# EasyEDA Pro project 2026Rc_R2_routed.epro

# Schematic Schematic1
Board Name: Board1; Create Date: 2025-09-02; Page Name: P1; Project Name: 2025物流车拓展板树莓派版专用; Schematic Name: Schematic1; Update Date: 2025-09-02; Company: 嘉立创EDA; Page Size: A4; Version: V1.0
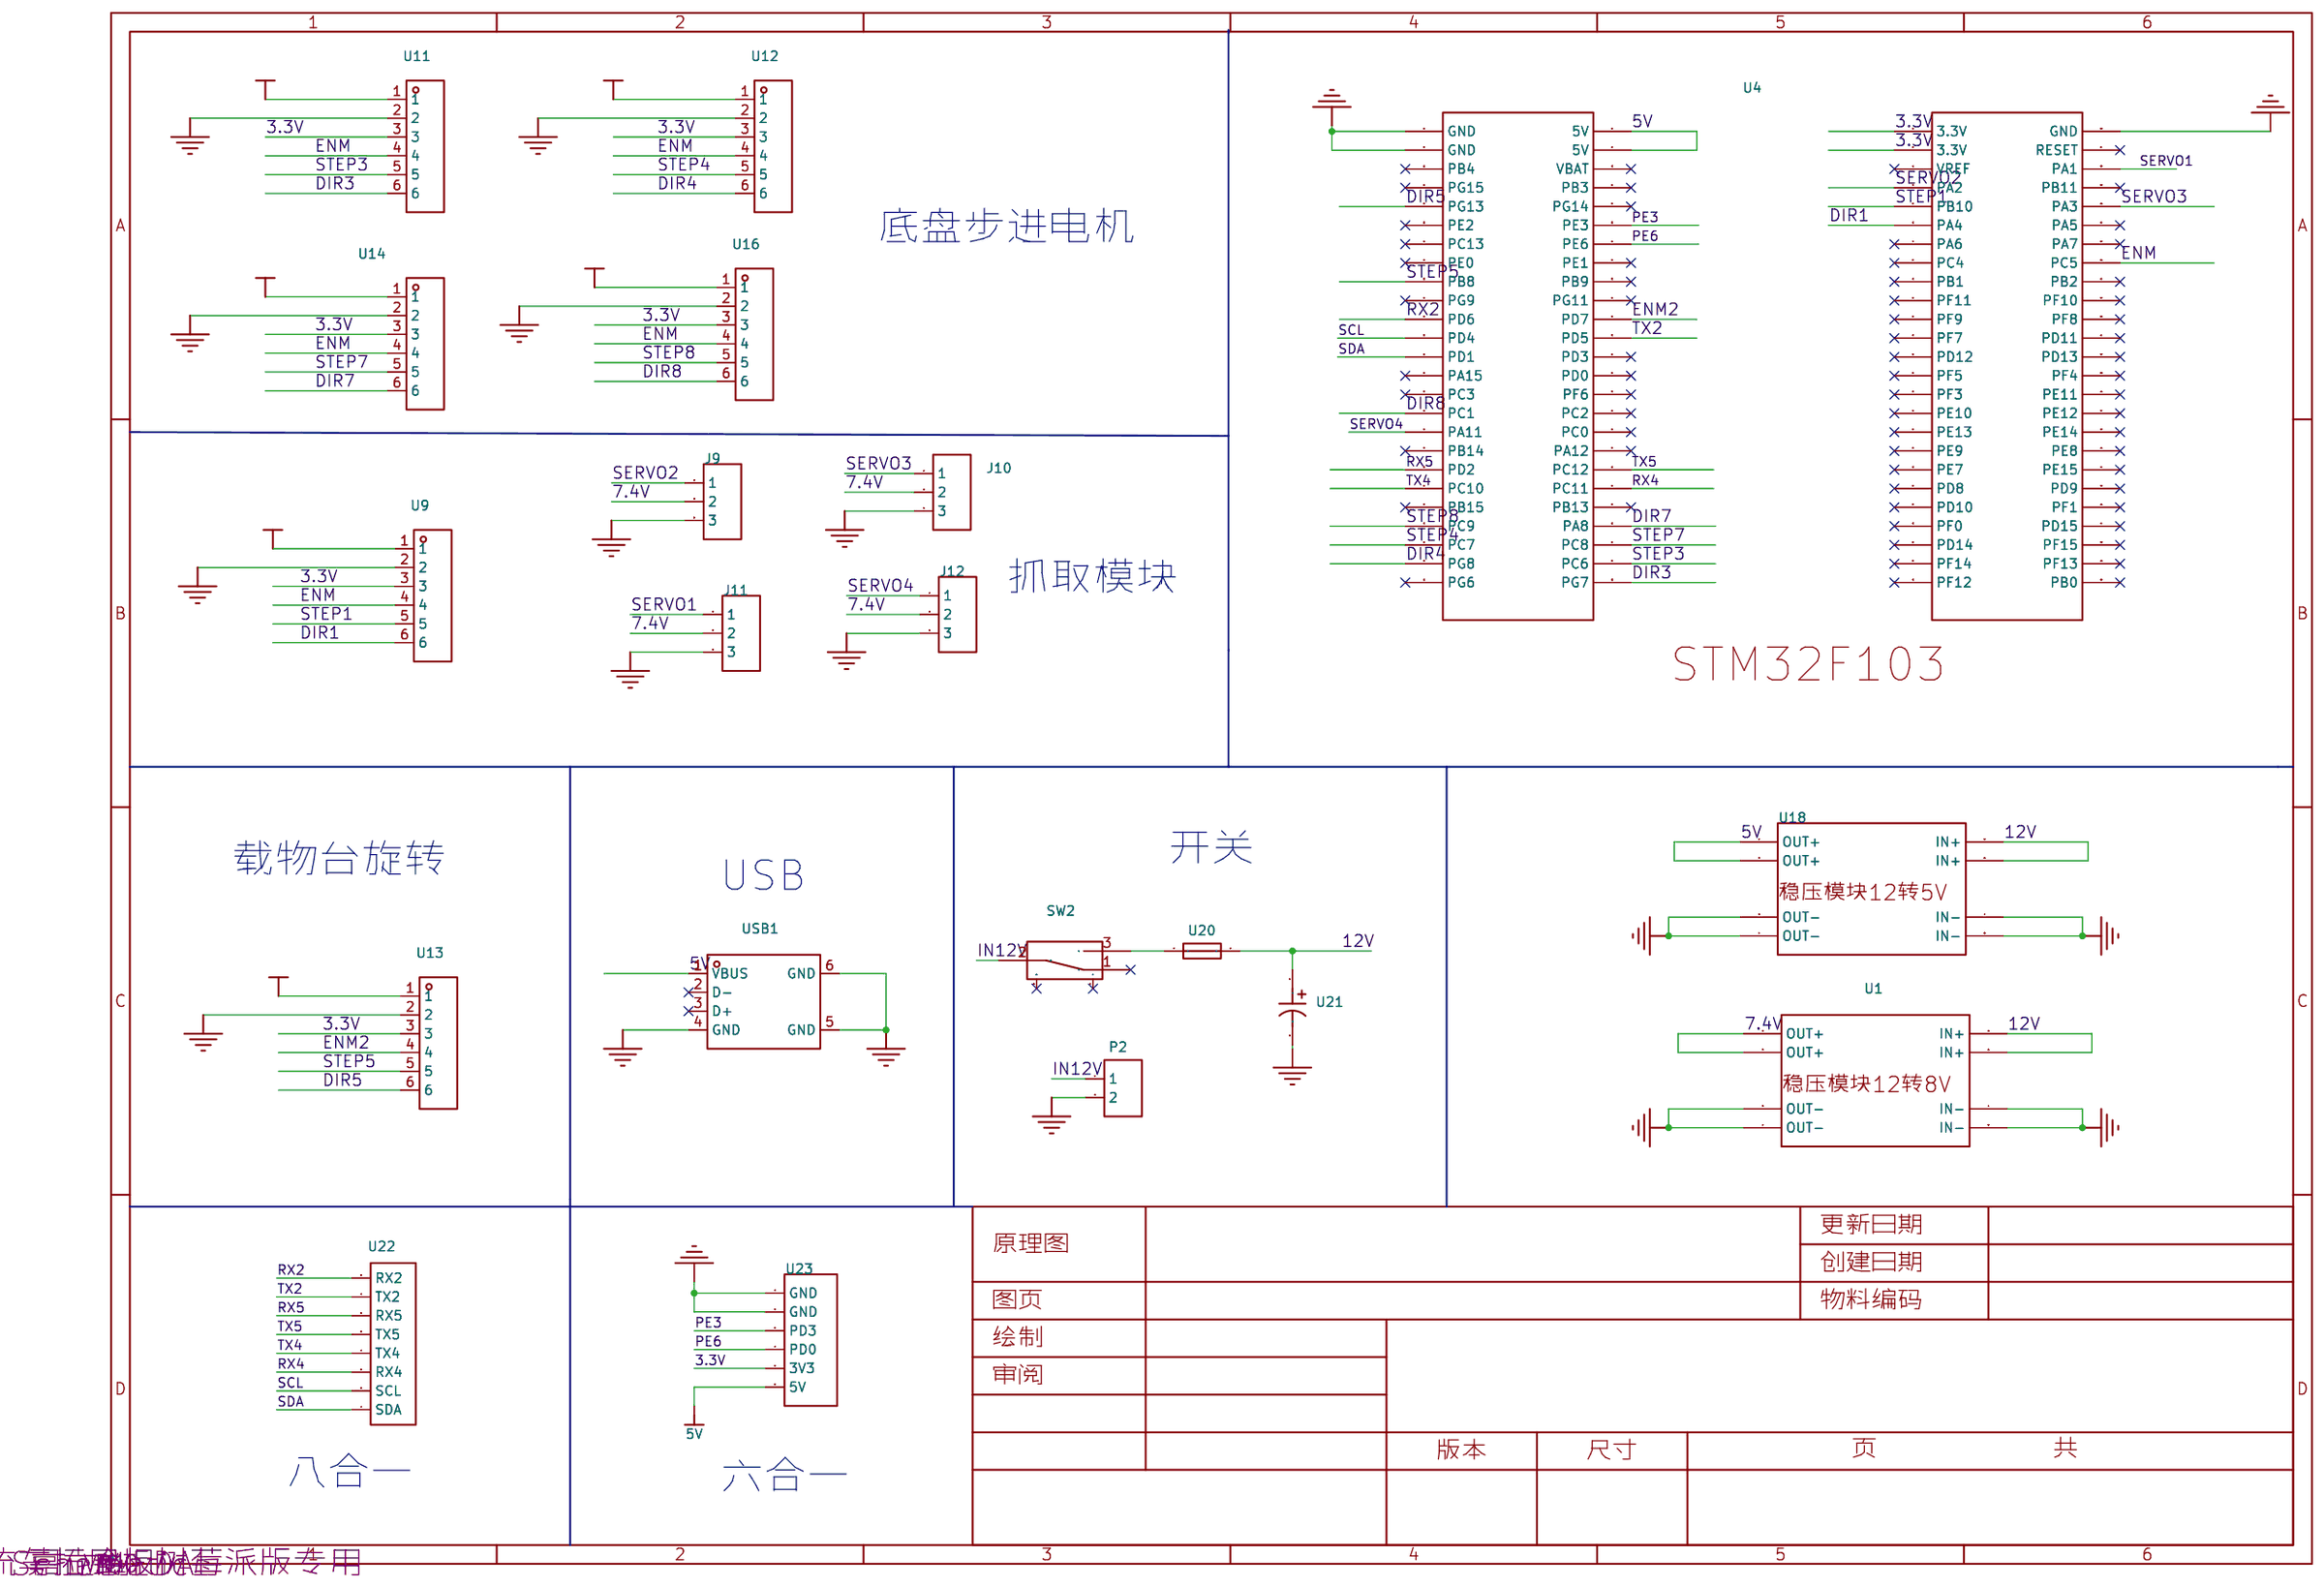
[diagram p0: schematic sheet]

## Parts
J9  舵机2  [HDR-M-2.54_1X3]
J10  舵机1  [HDR-M-2.54_1X3]
J11  舵机2  [HDR-M-2.54_1X3]
J12  舵机2  [HDR-M-2.54_1X3]
P2  输入  [CONN-TH_2P-P5.00]
SW2  SS-12F44-G5  [SW-TH_SS-12F44-G5]
U1  稳压模块12-8  [稳压模块12到8V]
U4  STM32_F103  [STM32F103]
U9  6PIN-2.54MM  [CONN-TH_XH2.54-6P]
U11  6PIN-2.54MM  [CONN-TH_XH2.54-6P]
U12  6PIN-2.54MM  [CONN-TH_XH2.54-6P]
U13  6PIN-2.54MM  [CONN-TH_XH2.54-6P]
U14  6PIN-2.54MM  [CONN-TH_XH2.54-6P]
U16  6PIN-2.54MM  [CONN-TH_XH2.54-6P]
U18  -  [稳压模块12到5V]
U20  -  [保险丝]
U21  -  [滤波电容220nf]
U22  -  [CN1]
U23  -  [CONN-TH_XH2.54-6P]
USB1  USB-231-ARY  [USB-A-TH_USB-231-ARY]

## Library data of the parts
J9 J11 J12 = 舵机2: Supplier Part: C180248; Supplier: LCSC
J10 = 舵机1: Supplier Part: C180248; Supplier: LCSC
P2 = 输入: Supplier: LCSC
SW2 = SS-12F44-G5: Supplier: LCSC; Supplier Part: C136718; Manufacturer: Rectangular Connectors - Contacts
U1 = 稳压模块12-8
U4 = STM32_F103
U9 U11-U14 U16 = 6PIN-2.54MM: Supplier: LCSC; Supplier Part: C9900021155; Manufacturer: null; JLCPCB Part Class: Extended Part
U18 = 稳压模块12-5
U20 = 保险丝
U21 = 滤波电容220nf
U22 = 八合一
U23 = 六合一
USB1 = USB-231-ARY: Supplier: LCSC; Supplier Part: C720525; Manufacturer: XUNPU(讯普); JLCPCB Part Class: Extended Part

## Nets
3.3V: U4.1(3.3V) U4.2(3.3V) U9.3 U11.3 U12.3 U13.3 U14.3 U16.3 U23.5(3V3)
5V: U4.76(5V) U4.77(5V) U18.1(OUT+) U18.2(OUT+) U23.6(5V) USB1.1(VBUS)
7.4V: J9.2 J10.2 J11.2 J12.2 U1.1(OUT+) U1.2(OUT+)
12V: U1.5(IN+) U1.6(IN+) U9.1 U11.1 U12.1 U13.1 U14.1 U16.1 U18.5(IN+) U18.6(IN+) U20.2 U21.1
GND: J9.3 J10.3 J11.3 J12.3 P2.2 U1.3(OUT-) U1.4(OUT-) U1.7(IN-) U1.8(IN-) U4.26(GND) U4.51(GND) U4.52(GND) U9.2 U11.2 U12.2 U13.2 U14.2 U16.2 U18.3(OUT-) U18.4(OUT-) U18.7(IN-) U18.8(IN-) U21.2 U23.1(GND) U23.2(GND) USB1.4(GND) USB1.5(GND) USB1.6(GND)
DIR1: U4.6(PA4) U9.6
DIR3: U4.100(PG7) U11.6
DIR4: U4.74(PG8) U12.6
DIR5: U4.55(PG13) U13.6
DIR7: U4.97(PA8) U14.6
DIR8: U4.66(PC1) U16.6
ENM: U4.33(PC5) U9.4 U11.4 U12.4 U14.4 U16.4
ENM2: U4.86(PD7) U13.4
IN12V: P2.1 SW2.2
PE3: U4.81(PE3) U23.3(PD3)
PE6: U4.82(PE6) U23.4(PD0)
RX2: U4.61(PD6) U22.8(RX2)
RX4: U4.95(PC11) U22.5(RX4)
RX5: U4.69(PD2) U22.2(RX5)
SCL: U4.62(PD4) U22.6(SCL)
SDA: U4.63(PD1) U22.7(SDA)
SERVO1: J11.1 U4.28(PA1)
SERVO2: J9.1 U4.4(PA2)
SERVO3: J10.1 U4.30(PA3)
SERVO4: J12.1 U4.67(PA11)
STEP1: U4.5(PB10) U9.5
STEP3: U4.99(PC6) U11.5
STEP4: U4.73(PC7) U12.5
STEP5: U4.59(PB8) U13.5
STEP7: U4.98(PC8) U14.5
STEP8: U4.72(PC9) U16.5
TX2: U4.87(PD5) U22.1(TX2)
TX4: U4.70(PC10) U22.4(TX4)
TX5: U4.94(PC12) U22.3(TX5)
$1N1669: SW2.3 U20.1

Not connected (* = marked no-connect by the designer): SW2 1* 4* 5*; U4 3(VREF)* 7(PA6)* 8(PC4)* 9(PB1)* 10(PF11)* 11(PF9)* 12(PF7)* 13(PD12)* 14(PF5)* 15(PF3)* 16(PE10)* 17(PE13)* 18(PE9)* 19(PE7)* 20(PD8)* 21(PD10)* 22(PF0)* 23(PD14)* 24(PF14)* 25(PF12)* 27(RESET)* 29(PB11)* 31(PA5)* 32(PA7)* 34(PB2)* 35(PF10)* 36(PF8)* 37(PD11)* 38(PD13)* 39(PF4)* 40(PE11)* 41(PE12)* 42(PE14)* 43(PE8)* 44(PE15)* 45(PD9)* 46(PF1)* 47(PD15)* 48(PF15)* 49(PF13)* 50(PB0)* 53(PB4)* 54(PG15)* 56(PE2)* 57(PC13)* 58(PE0)* 60(PG9)* 64(PA15)* 65(PC3)* 68(PB14)* 71(PB15)* 75(PG6)* 78(VBAT)* 79(PB3)* 80(PG14)* 83(PE1)* 84(PB9)* 85(PG11)* 88(PD3)* 89(PD0)* 90(PF6)* 91(PC2)* 92(PC0)* 93(PA12)* 96(PB13)*; USB1 2(D-)* 3(D+)*

## Notes on the sheet
- 底盘步进电机
- 抓取模块
- 载物台旋转
- 开关
- USB
- 八合一
- 六合一

# Board PCB1
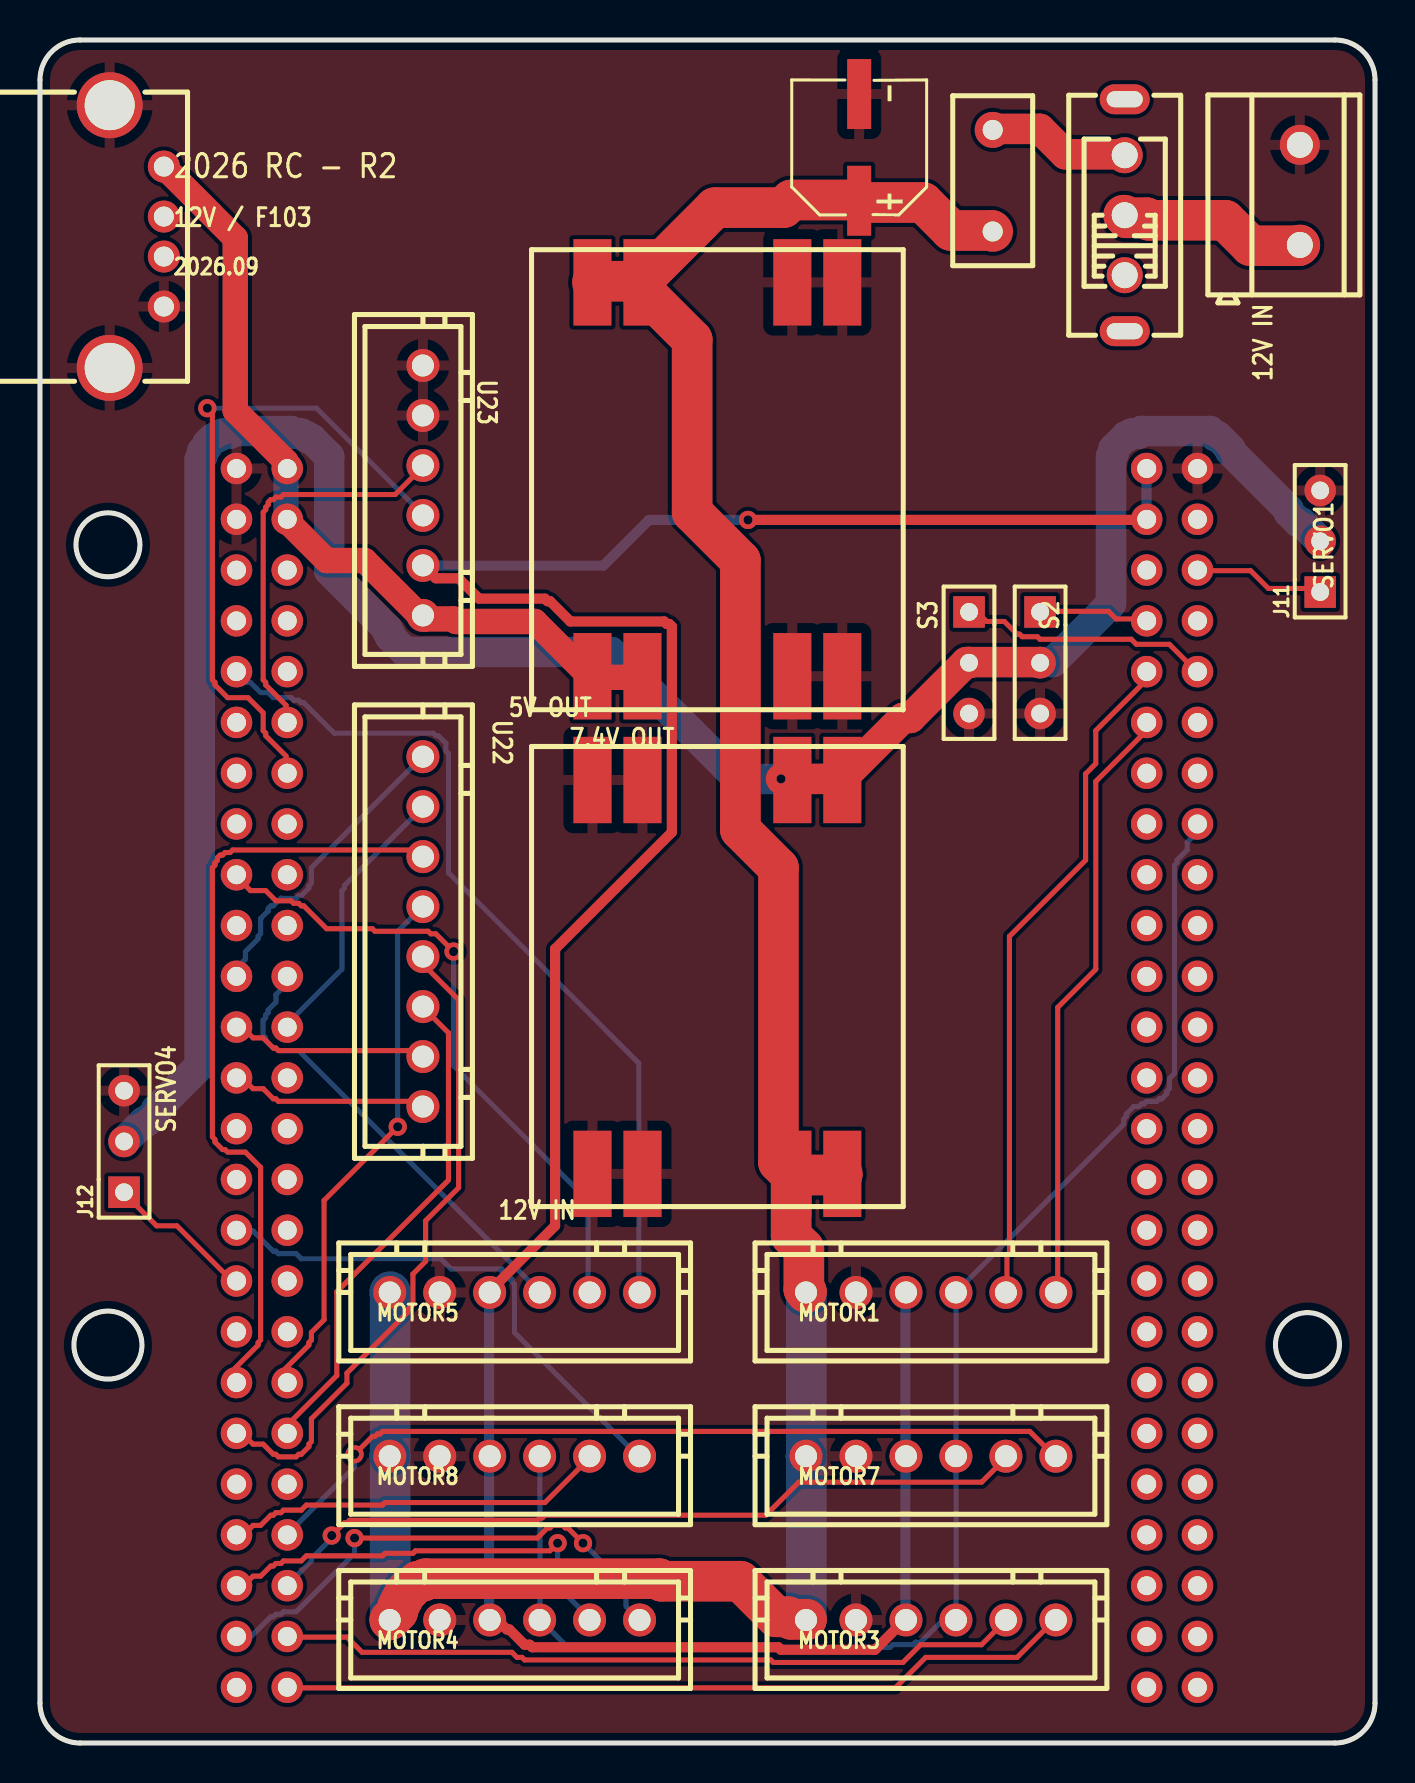
[diagram p1: board, top side]
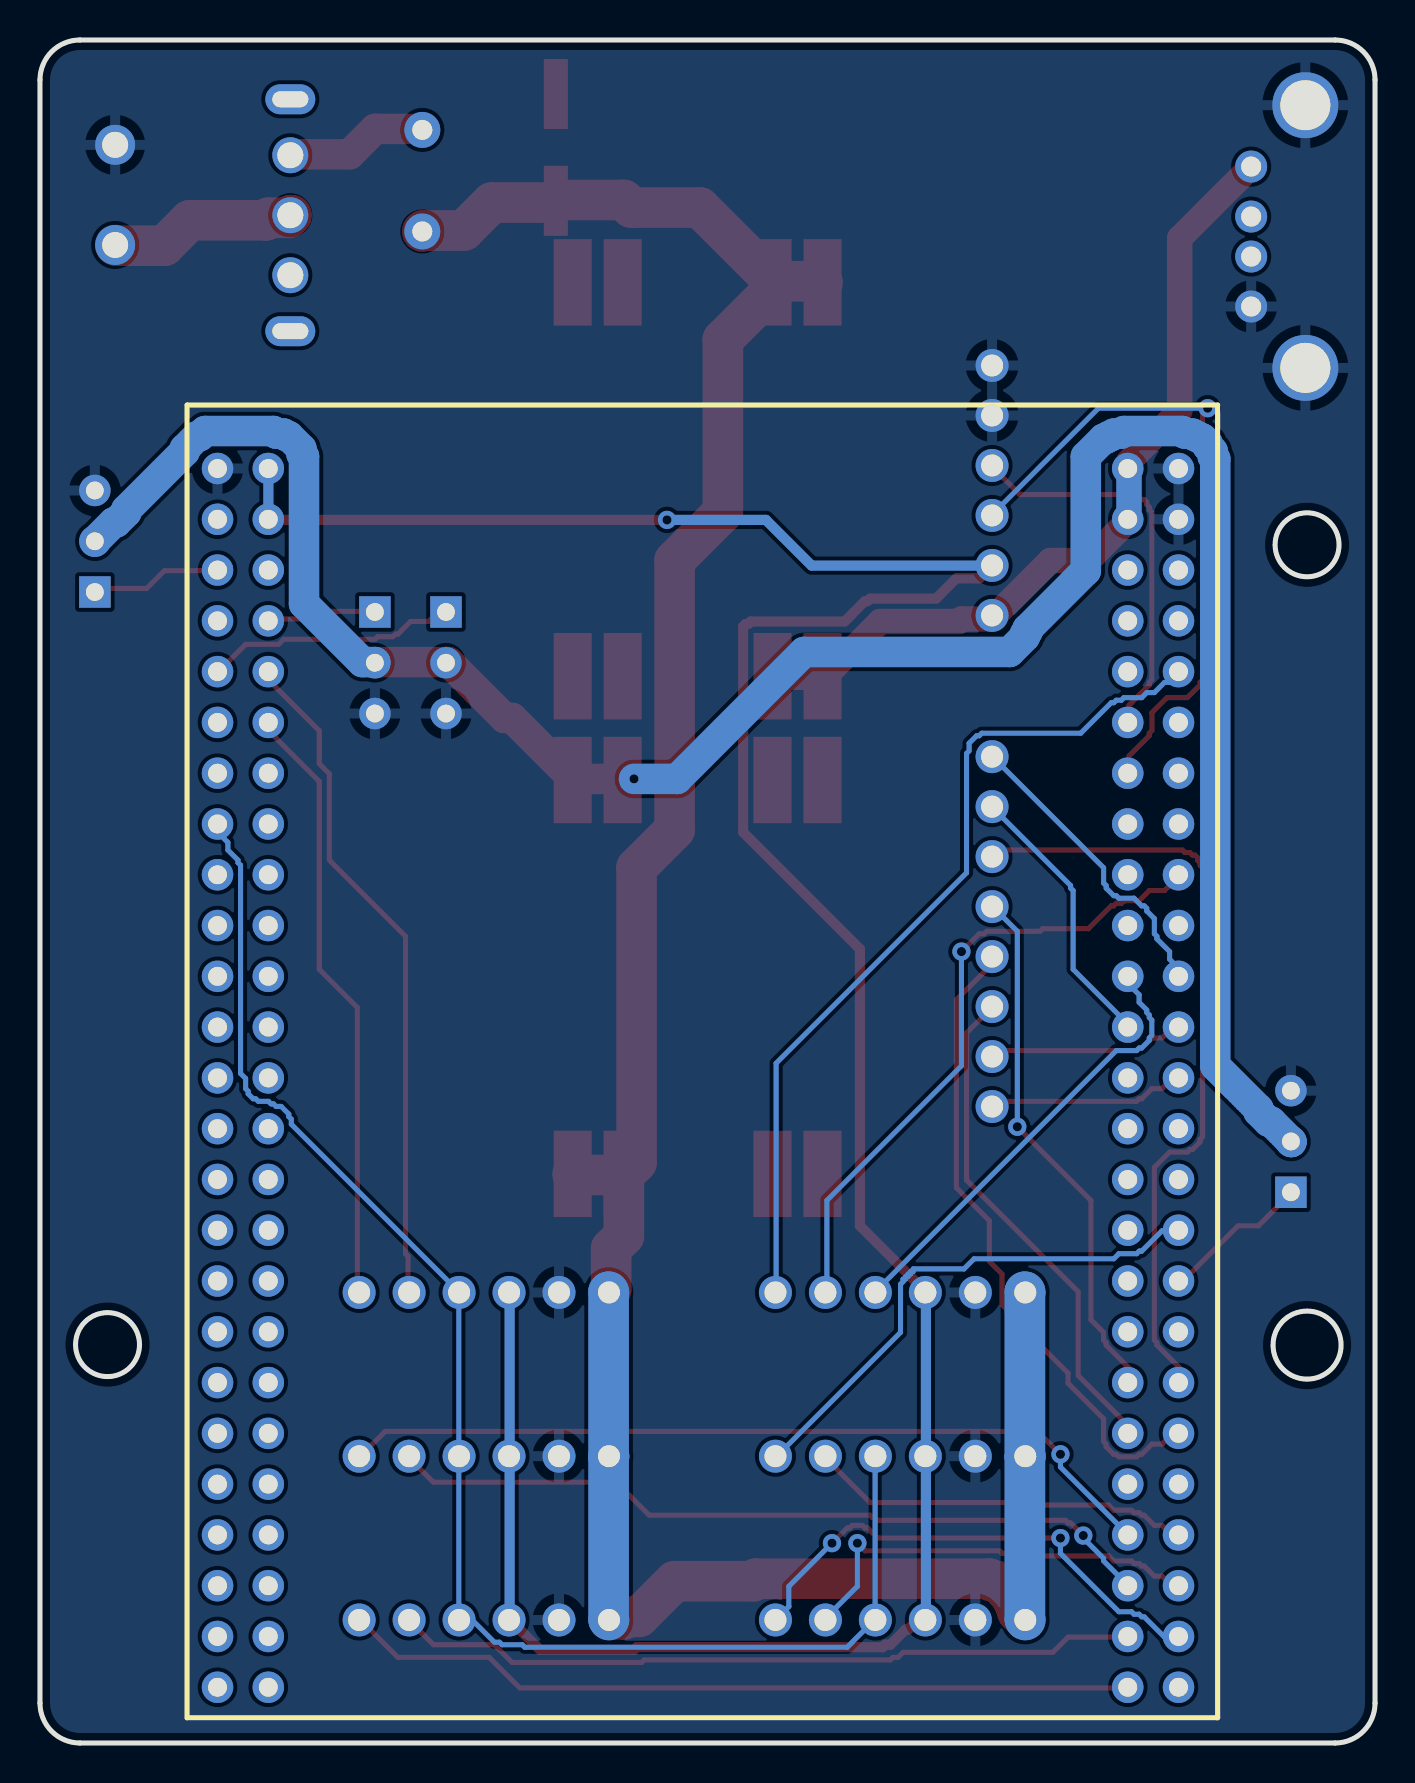
[diagram p2: board, bottom side, seen from below]

Outline 66.8 x 85.18 mm; copper layers: Top Layer, Bottom Layer. Coordinates in mm from the lower left corner of the outline.
Outline path: circle c3.4,59.93 r1.6 ; circle c3.4,19.9 r1.7 ; circle c63.42,19.93 r1.6 ; 0,83.18 0,2 arc(0.59,0.59) 2,0 64.8,0 arc(66.21,0.59) 66.8,2 66.8,83.18 arc(66.21,84.6) 64.8,85.18 2,85.18 arc(0.59,84.6) 0,83.18
Stack: Top Layer 0.035mm / Dielectric1 1.51mm FR4 er 4.5 / Bottom Layer 0.035mm

## Design rules (mm)
spacing copperThickness1oz (default): track to track 0.102, other pairs 0.152 to 0.3
spacing copperThickness2oz: track to track 0.203, other pairs 0.152 to 0.3
spacing Plane_innerPlane: track to track 0.102, other pairs 0.152 to 0.3
spacing Copper_copperRegion: track to track 0.102, other pairs 0.152 to 0.3
track width copperThickness1oz (default): min 0.127, default 0.254, max 2.54
track width copperThickness2oz: min 0.203, default 0.254, max 2.54
track width 5V: min 0.127, default 0.762, max 2.54
track width 12V: min 0.127, default 1.016, max 2.54
track width 3.3V: min 0.127, default 0.508, max 2.54
track width GND: min 0.127, default 0.762, max 2.54
differential pair differentialPair (default): width min 0.127, default 0.254, max 2.54; gap min 0.152, default 0.152
pour e10020 uses Copper_copperRegion
pour e10021 uses Copper_copperRegion

## Placement (name value [footprint] x y rotation side)
J9  舵机2  [HDR-M-2.54_1X3]  50.04 54.03 270 top
J10  舵机1  [HDR-M-2.54_1X3]  46.48 54.03 270 top
J11  舵机2  [HDR-M-2.54_1X3]  64.05 60.11 90 top
J12  舵机2  [HDR-M-2.54_1X3]  4.21 30.09 90 top
P2  输入  [CONN-TH_2P-P5.00]  63.03 77.43 90 top
SW2  SS-12F44-G5  [SW-TH_SS-12F44-G5]  54.27 76.42 90 top
U1  稳压模块12-8  [稳压模块12到8V]  33.89 38.32 90 top
U4  STM32_F103  [STM32F103]  33.66 34.09 180 bottom
U9  6PIN-2.54MM  [CONN-TH_XH2.54-6P]  44.58 22.54 0 top
U11  6PIN-2.54MM  [CONN-TH_XH2.54-6P]  44.58 6.15 0 top
U12  6PIN-2.54MM  [CONN-TH_XH2.54-6P]  23.75 6.15 0 top
U13  6PIN-2.54MM  [CONN-TH_XH2.54-6P]  23.75 22.54 0 top
U14  6PIN-2.54MM  [CONN-TH_XH2.54-6P]  44.58 14.35 0 top
U16  6PIN-2.54MM  [CONN-TH_XH2.54-6P]  23.75 14.35 0 top
U18  -  [稳压模块12到5V]  33.89 63.21 270 top
U20  -  [保险丝]  47.67 78.14 270 top
U21  -  [滤波电容220nf]  40.99 79.81 90 top
U22  -  [CN1]  19.07 40.59 270 top
U23  -  [CONN-TH_XH2.54-6P#2]  18.69 62.65 270 top
USB1  USB-231-ARY  [USB-A-TH_USB-231-ARY]  4.84 75.35 270 top

## Footprints (pads in the part's own frame, mm; a bottom-side part is the same pattern mirrored in y, then rotated)
CN1
  round 1.65 hole 1.1: 1(-6.25,0.094) 2(-3.75,0.094) 3(-1.25,0.094) 4(1.25,0.094) 5(3.75,0.094) 6(6.25,0.094) 7(8.75,0.094) 8(-8.75,0.094)
CONN-TH_2P-P5.00
  round 2 hole 1.3: 1(-2.505,0) 2(2.505,0)
CONN-TH_XH2.54-6P
  round 1.65 hole 1.1: 1(-6.25,0) 2(-3.75,0) 3(-1.25,0) 4(1.25,0) 5(3.75,0) 6(6.25,0)
CONN-TH_XH2.54-6P#2
  round 1.65 hole 1.1: 1(-6.25,0.475) 2(-3.75,0.475) 3(-1.25,0.475) 4(1.25,0.475) 5(3.75,0.475) 6(6.25,0.475)
HDR-M-2.54_1X3
  rect 1.575x1.575 hole 0.889: 1(-2.54,0)
  round 1.575 hole 0.889: 2(0,0) 3(2.54,0)
STM32F103
  round 1.575 hole 0.945: 1(-21.717,29.654) 2(-21.717,27.114) 3(-21.717,24.575) 4(-21.717,22.035) 5(-21.717,19.494) 6(-21.717,16.954) 7(-21.717,14.415) 8(-21.717,11.874) 9(-21.717,9.335) 10(-21.717,6.795) 11(-21.717,4.255) 12(-21.717,1.714) 13(-21.717,-0.826) 14(-21.717,-3.365) 15(-21.717,-5.905) 16(-21.717,-8.445) 17(-21.717,-10.986) 18(-21.717,-13.525) 19(-21.717,-16.066) 20(-21.717,-18.605) 21(-21.717,-21.145) 22(-21.717,-23.686) 23(-21.717,-26.226) 24(-21.717,-28.765) 25(-21.717,-31.305) 26(-24.257,29.654) 27(-24.257,27.114) 28(-24.257,24.575) 29(-24.257,22.035) 30(-24.257,19.494) 31(-24.257,16.954) 32(-24.257,14.415) 33(-24.257,11.874) 34(-24.257,9.335) 35(-24.257,6.795) 36(-24.257,4.255) 37(-24.257,1.714) 38(-24.257,-0.826) 39(-24.257,-3.365) 40(-24.257,-5.905) 41(-24.257,-8.445) 42(-24.257,-10.986) 43(-24.257,-13.525) 44(-24.257,-16.066) 45(-24.257,-18.605) 46(-24.257,-21.145) 47(-24.257,-23.686) 48(-24.257,-26.226) 49(-24.257,-28.765) 50(-24.257,-31.305) 51(23.823,29.654) 52(23.823,27.114) 53(23.823,24.575) 54(23.823,22.035) 55(23.823,19.494) 56(23.823,16.954) 57(23.823,14.415) 58(23.823,11.874) 59(23.823,9.335) 60(23.823,6.795) 61(23.823,4.255) 62(23.823,1.714) 63(23.823,-0.826) 64(23.823,-5.905) 65(23.823,-3.365) 66(23.823,-8.445) 67(23.823,-10.986) 68(23.823,-13.525) 69(23.823,-16.066) 70(23.823,-18.605) 71(23.823,-21.145) 72(23.823,-23.686) 73(23.823,-26.226) 74(23.823,-28.765) 75(23.823,-31.305) 76(21.283,29.654) 77(21.283,27.114) 78(21.283,24.575) 79(21.283,22.035) 80(21.283,19.494) 81(21.283,16.954) 82(21.283,14.415) 83(21.283,11.874) 84(21.283,9.335) 85(21.283,6.795) 86(21.283,4.255) 87(21.283,1.714) 88(21.283,-0.826) 89(21.283,-3.365) 90(21.283,-5.905) 91(21.283,-8.445) 92(21.283,-10.986) 93(21.283,-13.525) 94(21.283,-16.066) 95(21.283,-18.605) 96(21.283,-21.145) 97(21.283,-23.686) 98(21.283,-26.226) 99(21.283,-28.765) 100(21.283,-31.305)
SW-TH_SS-12F44-G5
  round 1.8 hole 1.3: 1(-3,0) 2(0,0) 3(3,0)
  oval 1.5x2.5 hole 0.8x1.8: 4(5.8,0) 5(-5.8,0)
USB-A-TH_USB-231-ARY
  round 1.6 hole 1: 1(-3.5,1.355) 2(-1,1.355) 3(1,1.355) 4(3.5,1.355)
  round 3.3 hole 2.5: 5(-6.57,-1.355) 6(6.57,-1.355)
保险丝
  round 1.8 hole 1: 1(-2.54,0) 2(2.54,0)
滤波电容220nf
  rect 3.5x1.2 smd: 1(-2.67,0) 2(2.67,0)
稳压模块12到5V
  rect 4.318x1.905 smd: 1(9.85,-6.252) 2(9.85,-3.752) 3(9.85,3.748) 4(9.85,6.248) 5(-9.85,-6.252) 6(-9.85,-3.752) 7(-9.85,3.748) 8(-9.85,6.248)
稳压模块12到8V
  rect 4.318x1.905 smd: 1(9.85,-6.252) 2(9.85,-3.752) 3(9.85,3.748) 4(9.85,6.248) 5(-9.85,-6.252) 6(-9.85,-3.752) 7(-9.85,3.748) 8(-9.85,6.248)

## Nets
As in the schematic.

Pads without a net: SW2 1 4 5; U4 3 7 8 9 10 11 12 13 14 15 16 17 18 19 20 21 22 23 24 25 27 29 31 32 34 35 36 37 38 39 40 41 42 43 44 45 46 47 48 49 50 53 54 56 57 58 60 64 65 68 71 75 78 79 80 83 84 85 88 89 90 91 92 93 96; USB1 2 3

## Via types
v1: diameter 0.914, hole 0.457, Top Layer to Bottom Layer, 10 vias

## Routing (per net, layer and track width the routed paths; a pad name or vN(x,y) marks a point on that pad's centre or on a via; arc(x,y) is an arc through that point)
3.3V: length 145.9
  Top Layer w0.508: U13.3 22.47,22.57 25.77,25.87 25.77,39.71 31.61,45.56 31.61,55.84 31.49,55.97 31.36,55.97 31.23,56.1 26.53,56.1 25.52,57.11 25.39,57.11 25.26,57.24 21.96,57.24 20.95,58.26 19.8,58.26 19.17,58.89 19.16,58.9 ; U12.3 22.47,6.19 22.85,6.19 23.36,5.68 23.49,5.68 24.25,4.92 24.5,4.92 24.63,4.79 36.95,4.79 37.08,4.66 41.77,4.66 43.3,6.19 U11.3 ; U4.2 55.36,61.18 v1(35.42,61.18)
  Bottom Layer w0.508: 22.47,14.31 U16.3 22.47,14.31 ; 22.47,14.31 22.47,22.57 U13.3 ; 22.47,14.31 22.47,6.19 U12.3 ; U11.3 43.3,6.19 43.3,14.31 ; 19.16,58.9 19.17,58.89 28.19,58.89 30.47,61.18 v1(35.42,61.18) ; U4.2 55.36,61.18 55.36,63.72 U4.1 ; 43.3,14.31 U14.3 43.3,14.31 ; 43.3,14.31 43.3,22.57 U9.3
5V: length 41.8
  Top Layer w1.27: 19.17,56.35 19.3,56.22 20.69,56.22 20.82,56.1 24.76,56.1 27.55,53.3 27.68,53.3 ; 19.17,56.35 19.04,56.35 16.25,59.15 14.34,59.15 12.31,61.18 U4.77 ; 19.17,56.35 U23.6 19.17,56.35 ; 27.68,53.3 U18.1 27.68,53.3 ; 27.68,53.3 30.09,53.3 U18.2 ; USB1.1 6.21,78.83 9.77,75.27 9.77,66.64 12.31,64.1 12.31,63.72 U4.76
  Bottom Layer w1.27: U4.76 12.31,63.72 12.31,61.18 U4.77
7.4V: length 117.9
  Top Layer w1.524: 37.58,48.22 v1(37.08,48.22) ; 37.58,48.22 U1.2 37.58,48.22 ; 37.58,48.22 40.12,48.22 ; 40.12,48.22 U1.1 40.12,48.22 ; 40.12,48.22 43.17,51.27 43.55,51.27 46.35,54.07 46.47,54.07 ; 46.47,54.07 50.03,54.07 J9.2 ; 46.47,54.07 J10.2 46.47,54.07
  Bottom Layer w1.524: J11.2 63.11,61.05 62.98,61.05 62.47,61.56 62.47,61.69 59.55,64.61 59.55,64.73 58.92,65.37 58.79,65.37 58.54,65.62 55.11,65.62 54.98,65.5 54.6,65.5 54.47,65.37 54.35,65.37 53.71,64.73 53.71,64.48 53.59,64.35 53.59,56.99 50.66,54.07 50.03,54.07 J9.2 ; J12.2 4.18,30.06 5.2,31.08 5.33,31.08 5.83,31.59 5.83,31.71 7.99,33.87 7.99,64.23 8.12,64.35 8.12,64.61 8.37,64.86 8.37,64.99 8.63,65.24 8.75,65.24 8.88,65.37 9.01,65.37 9.14,65.5 9.52,65.5 9.64,65.62 12.56,65.62 12.69,65.5 13.07,65.5 13.2,65.37 13.33,65.37 13.45,65.24 13.58,65.24 14.47,64.35 14.47,58.64 17.39,55.72 17.39,55.59 17.52,55.46 17.52,55.34 18.28,54.57 28.57,54.57 34.92,48.22 v1(37.08,48.22)
12V: length 135.6
  Top Layer w2.032: U9.1 38.34,22.57 38.22,22.7 38.22,24.73 37.58,25.36 37.58,28.41 ; U1.6 37.58,28.41 ; U1.6 37.58,28.41 ; U1.6 37.58,28.41 ; 37.58,28.41 36.95,29.05 36.95,43.78 35.04,45.68 35.04,59.15 32.63,61.56 32.63,70.19 30.09,72.73 30.09,73.12 ; 37.58,28.41 40.12,28.41 U1.5 ; U18.5 27.68,73.12 30.09,73.12 ; 30.09,73.12 U18.6 ; 30.09,73.12 U18.6 ; 30.09,73.12 U18.6 ; 30.09,73.12 33.77,76.8 37.2,76.8 37.58,77.18 41.01,77.18 ; 41.01,77.18 U21.1 41.01,77.18 ; 41.01,77.18 41.14,77.05 44.19,77.05 45.58,75.66 47.62,75.66 U20.2 ; U12.1 17.52,6.19 17.9,6.57 17.9,6.82 18.03,6.95 18.03,7.08 18.15,7.2 18.15,7.33 18.41,7.58 18.41,7.71 18.53,7.71 18.91,8.09 19.17,8.09 19.3,8.22 30.98,8.22 31.11,8.09 35.04,8.09 36.82,6.31 37.46,6.31 37.58,6.19 38.34,6.19 U11.1
  Bottom Layer w2.032: U9.1 38.34,22.57 38.34,14.31 ; U13.1 17.52,22.57 17.52,14.31 ; 17.52,14.31 U16.1 17.52,14.31 ; 17.52,14.31 17.52,6.19 U12.1 ; 38.34,14.31 U14.1 38.34,14.31 ; 38.34,14.31 38.34,6.19 U11.1
DIR1: length 30.4
  Top Layer w0.254: U4.6 55.36,51.02 55.36,50.64 52.82,48.1 52.82,38.7 50.92,36.79 50.92,22.7 50.79,22.57 U9.6
DIR3: length 40
  Top Layer w0.254: U4.100 12.31,2.76 42.79,2.76 44.31,4.28 48.89,4.28 50.79,6.19 U11.6
DIR4: length 25.6
  Top Layer w0.254: v1(15.74,10.25) 24.88,10.25 25.39,10.76 25.52,10.76 25.65,10.89 26.15,10.89 26.28,10.76 26.41,10.76 v1(27.17,10)
  Bottom Layer w0.254: v1(15.74,10.25) 15.74,9.49 12.82,6.57 12.18,6.57 12.06,6.44 11.8,6.44 11.68,6.31 11.55,6.31 10.53,5.3 9.77,5.3 9.83,5.33 ; U12.6 29.96,6.19 29.33,6.82 29.33,7.84 v1(27.17,10)
DIR5: length 43.6
  Bottom Layer w0.254: U13.6 29.96,22.57 29.96,34 20.44,43.52 20.44,49.49 20.31,49.62 20.31,50 19.93,50.38 19.8,50.38 19.68,50.51 14.72,50.51 13.2,52.03 13.07,52.03 12.95,52.16 12.69,52.16 12.56,52.29 11.68,52.29 11.42,52.54 11.04,52.54 10.53,53.05 10.28,53.05 9.77,53.56 9.83,53.59
DIR7: length 41.7
  Top Layer w0.254: U14.6 50.79,14.31 49.52,15.58 17.14,15.58 17.01,15.46 16.88,15.46 16.75,15.33 16.63,15.33 v1(15.74,14.44)
  Bottom Layer w0.254: U4.97 12.31,10.38 15.74,13.81 v1(15.74,14.44)
DIR8: length 26.8
  Bottom Layer w0.254: 9.83,25.65 9.77,25.62 10.66,25.62 11.68,24.6 11.8,24.6 11.93,24.47 12.82,24.47 13.07,24.22 20.06,24.22 20.56,23.71 23.11,23.71 23.11,23.59 23.23,23.59 23.23,23.46 23.36,23.46 23.36,23.33 23.49,23.33 23.49,23.2 23.61,23.2 23.61,23.08 23.74,22.95 23.74,20.54 29.96,14.31 U16.6
ENM: length 75.8
  Bottom Layer w0.254: 45.84,22.57 45.84,14.31 ; 45.84,22.57 54.22,30.95 54.22,31.21 54.35,31.33 54.35,31.46 54.73,31.84 54.98,31.84 55.11,31.97 55.24,31.97 55.36,32.09 55.87,32.09 56,32.22 56.12,32.22 56.38,32.48 56.38,32.6 56.51,32.73 56.51,33.24 56.76,33.49 56.76,43.91 56.89,44.03 56.89,44.16 57.4,44.67 57.4,45.05 57.9,45.56 57.9,45.94 U4.33 ; 45.84,22.57 U9.4 45.84,22.57 ; 45.84,14.31 U14.4 45.84,14.31 ; 45.84,14.31 45.84,6.19 ; 45.84,6.19 U11.4 45.84,6.19 ; 45.84,6.19 45.2,6.19 44.06,5.04 43.81,5.04 43.68,4.92 42.66,4.92 42.54,4.79 26.41,4.79 25.01,6.19 ; 25.01,6.19 25.01,14.31 U16.4 ; 25.01,6.19 U12.4 25.01,6.19
ENM2: length 22.7
  Bottom Layer w0.254: U4.86 12.31,38.32 12.31,37.94 11.8,37.43 11.8,37.05 11.42,36.67 11.42,36.54 11.29,36.41 11.29,36.29 11.17,36.16 11.17,35.4 11.29,35.27 11.29,35.14 11.68,34.76 11.8,34.76 11.93,34.63 12.95,34.63 25.01,22.57 U13.4
IN12V: length 9.5
  Top Layer w2.032: SW2.2 54.22,76.42 54.35,76.29 55.36,76.29 55.49,76.16 59.3,76.16 60.57,74.89 62.98,74.89 P2.1
PE3: length 20.2
  Top Layer w0.254: U4.81 12.31,51.02 12.31,51.91 11.29,52.92 11.29,53.05 11.17,53.18 11.17,61.56 11.29,61.69 11.29,61.81 11.42,61.94 11.42,62.07 11.55,62.19 11.68,62.19 11.8,62.32 12.06,62.32 12.18,62.45 17.77,62.45 19.17,63.84 19.16,63.9
PE6: length 33.6
  Top Layer w0.254: v1(8.37,66.77) 8.63,66.51 8.63,53.18 8.75,53.05 8.75,52.92 9.39,52.29 10.41,52.29 11.17,51.53 11.17,50.64 11.29,50.51 11.29,50.38 12.31,49.37 12.31,48.48 U4.82
  Bottom Layer w0.254: U23.4 19.17,61.43 13.83,66.77 v1(8.37,66.77)
RX2: length 15.6
  Bottom Layer w0.254: 9.83,38.35 9.77,38.32 9.77,38.7 10.28,39.21 10.28,39.59 10.91,40.22 10.91,40.35 11.04,40.48 11.04,41.24 11.42,41.62 11.42,41.75 11.55,41.87 11.68,41.87 12.06,42.25 12.82,42.25 12.95,42.38 13.07,42.38 13.45,42.76 13.45,42.89 13.58,43.02 13.58,43.78 19.17,49.37 U22.8
RX4: length 25.3
  Top Layer w0.254: U22.5 19.17,36.79 20.44,35.52 20.44,28.16 14.85,22.57 14.85,18.38 12.31,15.84 12.31,15.46 U4.95
RX5: length 39.2
  Top Layer w0.254: U22.2 19.17,44.29 18.79,44.67 9.64,44.67 9.52,44.54 9.26,44.54 9.14,44.41 9.01,44.41 8.88,44.29 8.88,44.16 8.75,44.03 8.75,43.91 8.63,43.78 8.63,30.32 8.75,30.19 8.75,30.06 9.14,29.68 9.26,29.68 9.39,29.55 10.28,29.55 11.04,28.79 11.04,20.16 10.91,20.03 10.91,19.9 9.77,18.76 9.77,18 9.83,18.03
SCL: length 10.1
  Top Layer w0.254: U22.6 19.17,34.38 18.91,34.63 11.93,34.63 11.8,34.76 11.68,34.76 11.17,35.27 10.66,35.27 10.15,35.78 9.77,35.78 9.83,35.81
SDA: length 10.1
  Top Layer w0.254: U22.7 19.17,31.84 18.91,32.09 11.93,32.09 11.8,32.22 11.68,32.22 11.17,32.73 10.66,32.73 10.15,33.24 9.77,33.24 9.83,33.27
SERVO1: length 6.6
  Top Layer w0.254: J11.1 63.87,57.75 61.46,57.75 60.57,58.64 57.9,58.64 U4.28
SERVO2: length 5.6
  Top Layer w0.254: U4.4 55.36,56.1 55.24,56.22 53.84,56.22 53.46,56.61 50.03,56.61 J9.1
SERVO3: length 12.8
  Top Layer w0.254: U4.30 57.9,53.56 56.51,54.95 54.86,54.95 54.6,55.21 50.03,55.21 49.9,55.34 49.14,55.34 49.01,55.46 48.89,55.46 48.25,56.1 47.36,56.1 46.85,56.61 46.47,56.61 J10.1
SERVO4: length 7.5
  Top Layer w0.254: 9.83,23.11 9.77,23.08 9.64,23.08 6.85,25.87 5.83,25.87 4.18,27.52 J12.1
STEP1: length 34
  Top Layer w0.254: U4.5 55.36,53.56 55.36,53.18 52.82,50.64 52.82,48.99 52.31,48.48 52.31,44.16 48.5,40.35 48.5,24.47 48.38,24.35 48.38,22.57 U9.5
STEP3: length 37.6
  Top Layer w0.254: U11.5 48.38,6.19 47.11,4.92 44.06,4.92 43.17,4.03 36.69,4.03 36.57,4.15 24.25,4.15 24.12,4.28 23.87,4.28 23.61,4.54 16.12,4.54 15.36,5.3 12.31,5.3 U4.99
STEP4: length 21.6
  Top Layer w0.254: 9.83,7.87 9.77,7.84 10.15,7.84 10.66,8.35 11.04,8.35 11.55,8.85 11.68,8.85 11.8,8.98 12.06,8.98 12.18,9.11 13.07,9.11 13.33,9.36 17.14,9.36 17.26,9.49 18.66,9.49 18.79,9.62 25.52,9.62 v1(25.9,10)
  Bottom Layer w0.254: v1(25.9,10) 25.9,7.84 27.55,6.19 U12.5
STEP5: length 32.5
  Top Layer w0.254: v1(20.69,39.59) 19.8,40.48 19.55,40.48 19.42,40.6 16.75,40.6 16.63,40.73 14.34,40.73 13.2,41.87 13.07,41.87 12.95,42 12.69,42 12.56,42.13 11.8,42.13 11.29,42.64 10.53,42.64 9.77,43.4 9.83,43.43
  Bottom Layer w0.254: v1(20.69,39.59) 20.69,33.87 27.42,27.14 27.42,22.7 27.55,22.57 U13.5
STEP7: length 39
  Top Layer w0.254: v1(14.6,10.38) 15.23,11.01 15.36,11.01 15.49,11.14 24.88,11.14 25.01,11.27 25.14,11.27 25.26,11.39 36.31,11.39 37.96,13.04 47.11,13.04 48.38,14.31 U14.5
  Bottom Layer w0.254: U4.98 12.31,7.84 13.58,9.11 13.58,9.23 14.6,10.25 v1(14.6,10.38)
STEP8: length 19.5
  Top Layer w0.254: U16.5 27.55,14.31 25.26,12.03 17.26,12.03 17.14,11.9 13.33,11.9 13.07,11.65 12.18,11.65 12.06,11.52 11.8,11.52 11.68,11.39 11.55,11.39 11.04,10.89 10.66,10.89 10.15,10.38 9.77,10.38 9.83,10.41
TX2: length 14
  Bottom Layer w0.254: U22.1 19.17,46.83 15.23,42.89 15.23,42.76 15.1,42.64 15.1,38.7 12.31,35.9 12.31,35.78 U4.87
TX4: length 32.8
  Top Layer w0.254: U22.4 19.17,39.33 19.3,39.21 19.3,38.83 20.95,37.17 20.95,27.78 19.3,26.13 19.3,24.09 18.66,23.46 18.66,21.93 18.41,21.68 18.41,21.55 15.36,18.51 15.36,18 13.58,16.22 13.58,15.08 13.45,14.95 13.45,14.82 13.07,14.44 12.95,14.44 12.82,14.31 11.93,14.31 11.8,14.44 11.68,14.44 11.17,14.95 10.66,14.95 10.15,15.46 9.77,15.46 9.83,15.49
TX5: length 26.8
  Top Layer w0.254: U4.94 12.31,18 12.31,18.76 13.45,19.9 13.45,20.03 13.58,20.16 13.58,20.54 14.22,21.17 14.22,27.14 v1(17.9,30.82)
  Bottom Layer w0.254: U22.3 19.17,41.87 17.9,40.6 v1(17.9,30.82)
$1N1669: length 7.3
  Top Layer w1.524: SW2.3 54.22,79.47 51.3,79.47 50.03,80.74 47.62,80.74 U20.1

## Copper pours and planes (outline as drawn; the poured copper is in the pictures)
GND on Top Layer: -0.01,85.18 66.79,85.18 66.79,-0.01 -0.01,-0.01
GND on Bottom Layer: -0.01,85.18 66.79,85.18 66.79,-0.01 -0.01,-0.01

## Text on the board
Top Silkscreen Layer: 2026.09 | MOTOR5 | MOTOR8 | MOTOR4 | MOTOR1 | MOTOR7 | MOTOR3 | 12V / F103 | 12V IN | 5V OUT | 7.4V OUT | SERVO4 | S3 | S2 | SERVO1 | U23 | U22 | 2026 RC - R2
